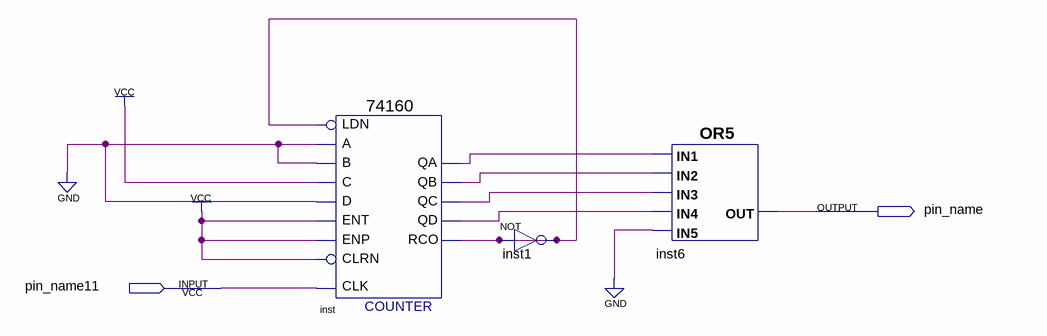
[diagram p0: schematic sheet]
// Quartus schematic debug.bdf as structural Verilog: 3 symbols, 2 pins
module debug (
  input  pin_name11,
  output pin_name
);

  wire inst_qa, inst_qb, inst_qc, inst_qd, inst_rco;

  \74160  inst (
    .CLK(pin_name11), .ENT(1'b1), .A(1'b0), .B(1'b0), .C(1'b1), .D(1'b0), .LDN(inst_rco), .ENP(1'b1),
    .CLRN(1'b1), .QD(inst_qd), .QA(inst_qa), .QB(inst_qb), .QC(inst_qc), .RCO(inst_rco));
  not inst1 (inst_rco, inst_rco);
  or inst6 (pin_name, inst_qa, inst_qb, inst_qc, inst_qd, 1'b0);
endmodule
